# Altium schematic sheet POWER_TOP.SchDoc
size 420 x 297 mm; Author: Лотов М.Д.; Address1: Address1; Address2: Address2; Address3: Address3; Address4: Address4; DocumentNumber: POWER_TOP; SheetNumber: 1; SheetTotal: 5; Scale: 1:1; DocumentType: Схема электрическая принципиальная; FirstReferrence: АБВГ.123456.001
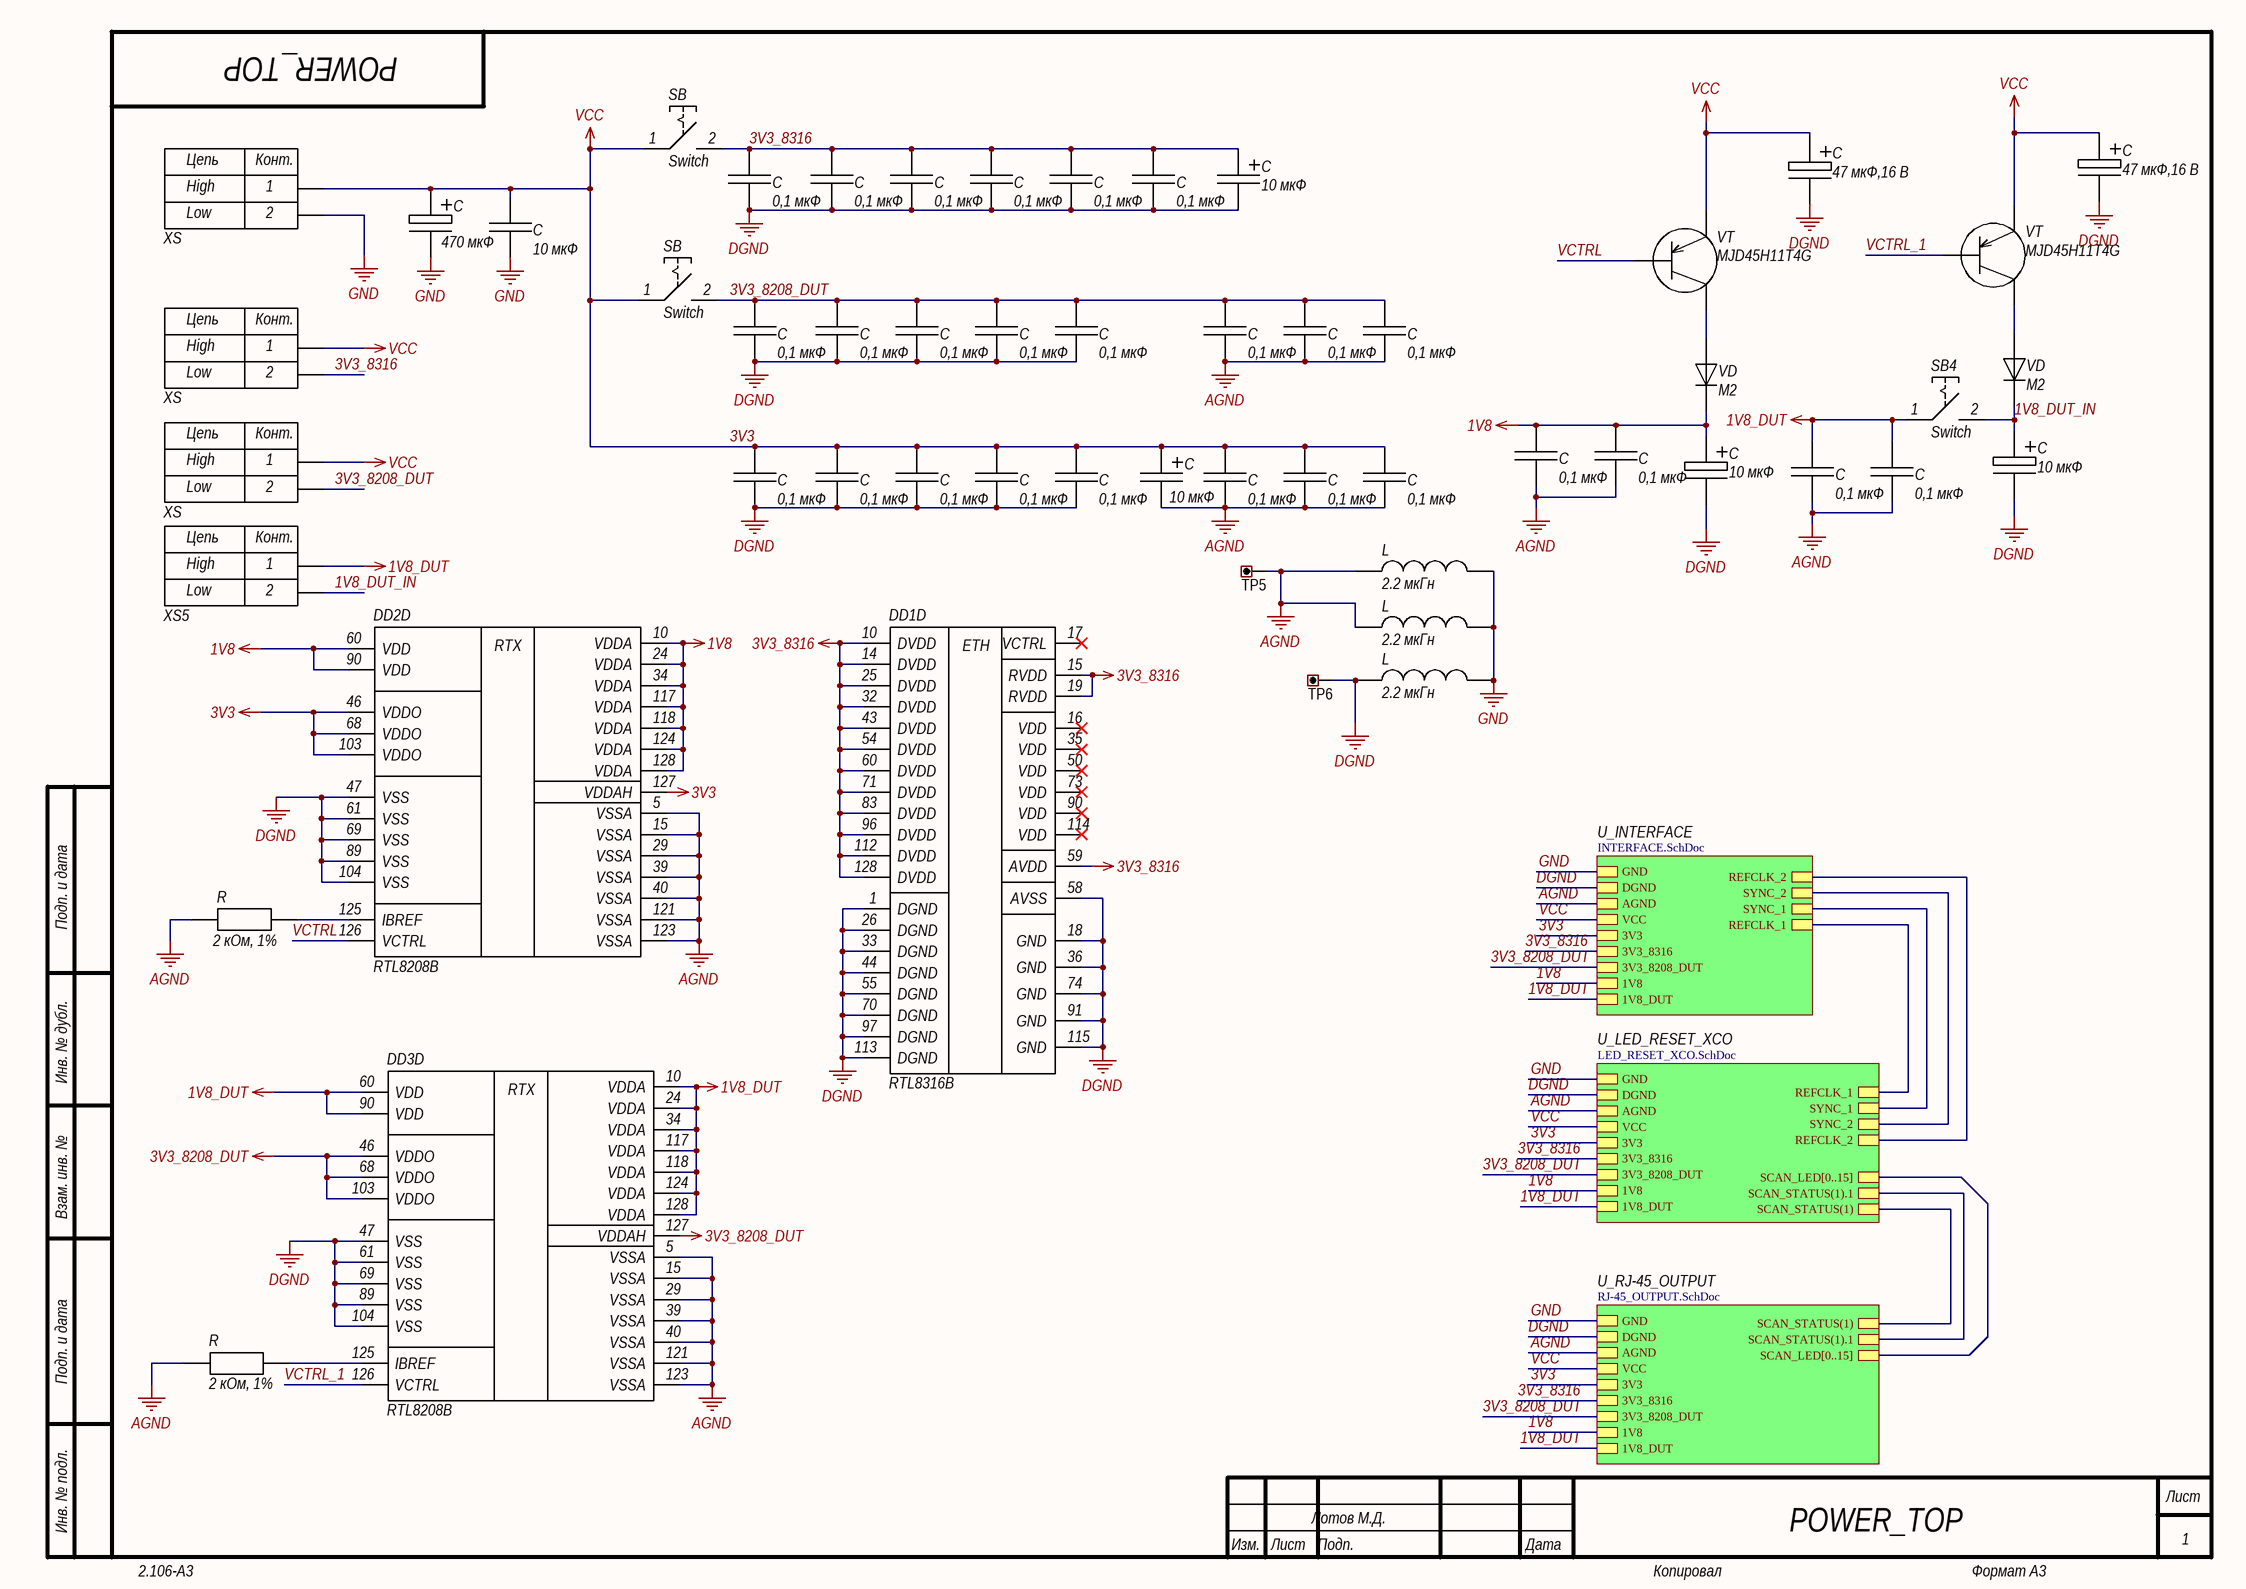
[diagram p0: POWER_TOP.SchDoc]

## Parts
(Parts that share a designator on the sheet are numbered #1, #2 ... from top to bottom, then left to right.)
C#1  47 мкФ,16 В  [C_alumin_D=6.3mm]
C#2  47 мкФ,16 В  [C_alumin_D=6.3mm]
C#3  0,1 мкФ  [C0603]
C#4  0,1 мкФ  [C0603]
C#5  0,1 мкФ  [C0603]
C#6  0,1 мкФ  [C0603]
C#7  0,1 мкФ  [C0603]
C#8  0,1 мкФ  [C0603]
C#9  10 мкФ  [TECAP_type C]
C#10  470 мкФ  [C_alumin_8x10mm]
C#11  10 мкФ  [C0805]
C#12  0,1 мкФ  [C0603]
C#13  0,1 мкФ  [C0603]
C#14  0,1 мкФ  [C0603]
C#15  0,1 мкФ  [C0603]
C#16  0,1 мкФ  [C0603]
C#17  0,1 мкФ  [C0603]
C#18  0,1 мкФ  [C0603]
C#19  0,1 мкФ  [C0603]
C#20  0,1 мкФ  [C0603]
C#21  0,1 мкФ  [C0603]
C#22  10 мкФ  [C_alumin_D=4mm]
C#23  10 мкФ  [C_alumin_D=4mm]
C#24  0,1 мкФ  [C0603]
C#25  0,1 мкФ  [C0603]
C#26  0,1 мкФ  [C0603]
C#27  0,1 мкФ  [C0603]
C#28  0,1 мкФ  [C0603]
C#29  10 мкФ  [TECAP_type C]
C#30  0,1 мкФ  [C0603]
C#31  0,1 мкФ  [C0603]
C#32  0,1 мкФ  [C0603]
C#33  0,1 мкФ  [C0603]
C#34  0,1 мкФ  [C0603]
DD1  RTL8316B  [QFP-128_(14x20mm)_0.5mm_ZIF]  (part D of 4)
DD2  RTL8208B  [QFP-128_14x20mm_0.5mm]  (part D of 4)
DD3  RTL8208B  [QFP-128_(14x20mm)_0.5mm_ZIF]  (part D of 4)
L#1  2.2 мкГн  [CD43_Inductor]
L#2  2.2 мкГн  [CD43_Inductor]
L#3  2.2 мкГн  [CD43_Inductor]
R#1  2 кОм, 1%  [R0603]
R#2  2 кОм, 1%  [R0603]
SB4  Switch  [Switch_rocker]
SB#1  Switch  [Switch_rocker]
SB#2  Switch  [Switch_rocker]
TP5  (no value)  [PLS-1]
TP6  (no value)  [PLS-1]
VD#1  M2  [DO-214AC]
VD#2  M2  [DO-214AC]
VT#1  MJD45H11T4G  [DPAK]
VT#2  MJD45H11T4G  [DPAK]
XS5  Banana  [Banana_Connect]  (value not drawn)
XS#1  Banana  [Banana_Connect]  (value not drawn)
XS#2  Banana  [Banana_Connect]  (value not drawn)
XS#3  Banana  [Banana_Connect]  (value not drawn)

## Sub-sheets
U_INTERFACE = INTERFACE.SchDoc: GND, DGND, AGND, VCC, 3V3, 3V3_8316, 3V3_8208_DUT, 1V8, 1V8_DUT, REFCLK_2, SYNC_2, SYNC_1, REFCLK_1
U_LED_RESET_XCO = LED_RESET_XCO.SchDoc: GND, DGND, AGND, VCC, 3V3, 3V3_8316, 3V3_8208_DUT, 1V8, 1V8_DUT, REFCLK_1, REFCLK_2, SYNC_1, SYNC_2, SCAN_LED[0..15], SCAN_STATUS(1).1, SCAN_STATUS(1)
U_RJ-45_OUTPUT = RJ-45_OUTPUT.SchDoc: GND, DGND, AGND, VCC, 3V3, 3V3_8316, 3V3_8208_DUT, 1V8, 1V8_DUT, SCAN_STATUS(1), SCAN_STATUS(1).1, SCAN_LED[0..15]

## Nets
1V8: C#20.1 C#21.1 C#23.1 DD2.10(VDDA) DD2.24(VDDA) DD2.34(VDDA) DD2.60(VDD) DD2.90(VDD) DD2.117(VDDA) DD2.118(VDDA) DD2.124(VDDA) DD2.128(VDDA) VD#1.1 ; sheet U_INTERFACE/1V8, sheet U_LED_RESET_XCO/1V8, sheet U_RJ-45_OUTPUT/1V8
1V8_DUT: C#33.1 C#34.1 DD3.10(VDDA) DD3.24(VDDA) DD3.34(VDDA) DD3.60(VDD) DD3.90(VDD) DD3.117(VDDA) DD3.118(VDDA) DD3.124(VDDA) DD3.128(VDDA) SB4.1 XS5.1 ; sheet U_INTERFACE/1V8_DUT, sheet U_LED_RESET_XCO/1V8_DUT, sheet U_RJ-45_OUTPUT/1V8_DUT
3V3: C#1.1 C#2.1 C#10.1 C#11.1 C#24.1 C#25.1 C#26.1 C#27.1 C#28.1 C#29.1 C#30.1 C#31.1 C#32.1 DD2.46(VDDO) DD2.68(VDDO) DD2.103(VDDO) DD2.127(VDDAH) SB#1.1 SB#2.1 VT#1.2 VT#2.2 XS#1.1 XS#2.1 XS#3.1 ; sheet U_INTERFACE/VCC, sheet U_INTERFACE/3V3, sheet U_LED_RESET_XCO/VCC, sheet U_LED_RESET_XCO/3V3, sheet U_RJ-45_OUTPUT/VCC, sheet U_RJ-45_OUTPUT/3V3  [also labelled VCC]
3V3_8208_DUT: C#12.1 C#13.1 C#14.1 C#15.1 C#16.1 C#17.1 C#18.1 C#19.1 DD3.46(VDDO) DD3.68(VDDO) DD3.103(VDDO) DD3.127(VDDAH) SB#2.2 XS#3.2 ; sheet U_INTERFACE/3V3_8208_DUT, sheet U_LED_RESET_XCO/3V3_8208_DUT, sheet U_RJ-45_OUTPUT/3V3_8208_DUT
3V3_8316: C#3.1 C#4.1 C#5.1 C#6.1 C#7.1 C#8.1 C#9.1 DD1.10(DVDD) DD1.14(DVDD) DD1.15(RVDD) DD1.19(RVDD) DD1.25(DVDD) DD1.32(DVDD) DD1.43(DVDD) DD1.54(DVDD) DD1.59(AVDD) DD1.60(DVDD) DD1.71(DVDD) DD1.83(DVDD) DD1.96(DVDD) DD1.112(DVDD) DD1.128(DVDD) SB#1.2 XS#2.2 ; sheet U_INTERFACE/3V3_8316, sheet U_LED_RESET_XCO/3V3_8316, sheet U_RJ-45_OUTPUT/3V3_8316
AGND: C#17.2 C#18.2 C#19.2 C#20.2 C#21.2 C#29.2 C#30.2 C#31.2 C#32.2 C#33.2 C#34.2 DD2.5(VSSA) DD2.15(VSSA) DD2.29(VSSA) DD2.39(VSSA) DD2.40(VSSA) DD2.121(VSSA) DD2.123(VSSA) DD3.5(VSSA) DD3.15(VSSA) DD3.29(VSSA) DD3.39(VSSA) DD3.40(VSSA) DD3.121(VSSA) DD3.123(VSSA) L#1.1(x) L#2.1(x) R#1.1(x) R#2.1(x) TP5.1 ; sheet U_INTERFACE/AGND, sheet U_LED_RESET_XCO/AGND, sheet U_RJ-45_OUTPUT/AGND
DGND: C#1.2 C#2.2 C#3.2 C#4.2 C#5.2 C#6.2 C#7.2 C#8.2 C#9.2 C#12.2 C#13.2 C#14.2 C#15.2 C#16.2 C#22.2 C#23.2 C#24.2 C#25.2 C#26.2 C#27.2 C#28.2 DD1.1(DGND) DD1.18(GND) DD1.26(DGND) DD1.33(DGND) DD1.36(GND) DD1.44(DGND) DD1.55(DGND) DD1.58(AVSS) DD1.70(DGND) DD1.74(GND) DD1.91(GND) DD1.97(DGND) DD1.113(DGND) DD1.115(GND) DD2.47(VSS) DD2.61(VSS) DD2.69(VSS) DD2.89(VSS) DD2.104(VSS) DD3.47(VSS) DD3.61(VSS) DD3.69(VSS) DD3.89(VSS) DD3.104(VSS) L#3.2 TP6.1 ; sheet U_INTERFACE/DGND, sheet U_LED_RESET_XCO/DGND, sheet U_RJ-45_OUTPUT/DGND
GND: C#10.2 C#11.2 L#1.2 L#2.2 L#3.1(x) XS#1.2 ; sheet U_INTERFACE/GND, sheet U_LED_RESET_XCO/GND, sheet U_RJ-45_OUTPUT/GND
1V8_DUT_IN: C#22.1 SB4.2 VD#2.1 XS5.2
VCTRL: DD2.126(VCTRL) VT#2.1
VCTRL_1: DD3.126(VCTRL) VT#1.1
NetDD2_125: DD2.125(IBREF) R#1.2
NetDD3_125: DD3.125(IBREF) R#2.2
NetVD#1_2: VD#1.2 VT#2.3
NetVD#2_2: VD#2.2 VT#1.3
(unnamed): sheet U_INTERFACE/REFCLK_2, sheet U_LED_RESET_XCO/REFCLK_2
(unnamed): sheet U_INTERFACE/SYNC_2, sheet U_LED_RESET_XCO/SYNC_2
(unnamed): sheet U_INTERFACE/SYNC_1, sheet U_LED_RESET_XCO/SYNC_1
(unnamed): sheet U_INTERFACE/REFCLK_1, sheet U_LED_RESET_XCO/REFCLK_1
(unnamed): sheet U_LED_RESET_XCO/SCAN_STATUS(1).1, sheet U_RJ-45_OUTPUT/SCAN_STATUS(1).1
(unnamed): sheet U_LED_RESET_XCO/SCAN_STATUS(1), sheet U_RJ-45_OUTPUT/SCAN_STATUS(1)

Not connected (* = marked no-connect by the designer): DD1 16(VDD)* 17(VCTRL)* 35(VDD)* 50(VDD)* 73(VDD)* 90(VDD)* 114(VDD)*

## Buses and harness runs
bus sheet U_LED_RESET_XCO/SCAN_LED[0..15] = sheet U_RJ-45_OUTPUT/SCAN_LED[0..15]

## Notes on the sheet
- Подп. и дата
- Инв. № дубл.
- Взам. инв. №
- Инв. № подл.
- Изм.
- Лист
- Подп.
- Дата
- 2.106-A3
- Копировал
- Формат А3
- (in symbol Banana) Цепь; Конт.; High; Low
- (in symbol RTL8208B, part D) RTX
- (in symbol RTL8316B, part D) ETH

## Library data of the parts
C#1 C#2 C#10 C#22 C#23 = Cap_Electrolyte
C#3-C#8 C#11-C#21 C#24-C#28 C#30-C#34 = Capacitance_SMD
C#9 C#29 = T_Cap_SMD
L#1-L#3 = Inductance_SMD
R#1 R#2 = Resistor_SMD
SB4 SB#1 SB#2 = Switch Rocker: ON-OFF SPST Switch
TP5 TP6 = Connector_Test_Point: Manufacturer: Keystone; ValueManufacturerPartNumber: Test point, Keystone, 5001; PartNumber: 5001; TypeConnector: Test point; HelpURL: https://www.digikey.com/product-detail/en/keystone-electronics/5001/36-5001-ND/255327
VD#1 VD#2 = Diode
VT#1 VT#2 = PNP
XS5 XS#1-XS#3 = Banana: Banana Connectors